# Altium schematic sheet 03_ADV7511_HDMI_OUT.SchDoc
size A3; SheetNumber: 4; SheetTotal: 6
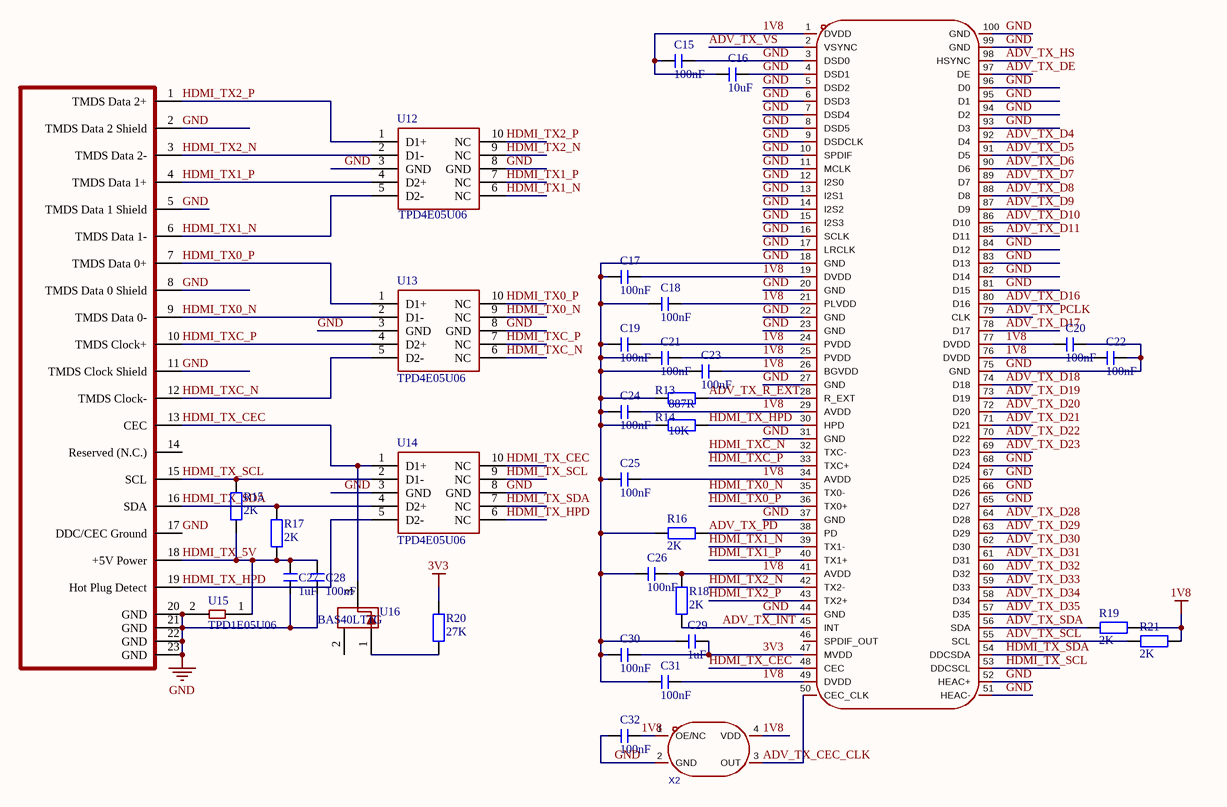
[diagram p0: 03_ADV7511_HDMI_OUT.SchDoc]

## Parts
C15  100nF  [C 0603_L]
C16  10uF  [C 0603_L]
C17  100nF  [C 0603_L]
C18  100nF  [C 0603_L]
C19  100nF  [C 0603_L]
C20  100nF  [C 0603_L]
C21  100nF  [C 0603_L]
C22  100nF  [C 0603_L]
C23  100nF  [C 0603_L]
C24  100nF  [C 0603_L]
C25  100nF  [C 0603_L]
C26  100nF  [C 0603_L]
C27  1uF  [C 0603_L]
C28  100nF  [C 0603_L]
C29  1uF  [C 0603_L]
C30  100nF  [C 0603_L]
C31  100nF  [C 0603_L]
C32  100nF  [C 0603_L]
R13  887R  [R 0603_L]
R14  10K  [R 0603_L]
R15  2K  [R 0603_L]
R16  2K  [R 0603_L]
R17  2K  [R 0603_L]
R18  2K  [R 0603_L]
R19  2K  [R 0603_L]
R20  27K  [R 0603_L]
R21  2K  [R 0603_L]
U5  adv7511kstz  [LQFP-100_L14.0-W14.0-P0.50-LS16.0-BL]  (value not drawn)
U12  TPD4E05U06  [TPD4E05U06DQAR]
U13  TPD4E05U06  [TPD4E05U06DQAR]
U14  TPD4E05U06  [TPD4E05U06DQAR]
U15  TPD1E05U06  [TPD1E05U06]
U16  BAS40LT1G  [BAS40LT1G]
USB3  hdmi-001s  [HDMI-SMD_HDMI-001S]  (value not drawn)
X2  ot322512mjba4sl  [OSC-SMD_4P-L3.2-W2.5-BL]  (value not drawn)

## Nets
1V8: C15.2 C16.2 C17.1 C18.1 C19.1 C20.2 C21.1 C22.2 C23.1 C24.1 C25.1 C26.1 C31.1 C32.1 R18.1 R19.2 R21.2 U5.1(DVDD) U5.19(DVDD) U5.21(PLVDD) U5.24(PVDD) U5.25(PVDD) U5.26(BGVDD) U5.29(AVDD) U5.34(AVDD) U5.41(AVDD) U5.49(DVDD) U5.76(DVDD) U5.77(DVDD) X2.1(OE/NC) X2.4(VDD)
3V3: C29.1 C30.1 R20.2 U5.47(MVDD)
GND: C15.1 C16.1 C17.2 C18.2 C19.2 C20.1 C21.2 C22.1 C23.2 C24.2 C25.2 C26.2 C27.2 C28.2 C29.2 C30.2 C31.2 C32.2 R13.1 R14.1 R16.1 U5.3(DSD0) U5.4(DSD1) U5.5(DSD2) U5.6(DSD3) U5.7(DSD4) U5.8(DSD5) U5.9(DSDCLK) U5.10(SPDIF) U5.11(MCLK) U5.12(I2S0) U5.13(I2S1) U5.14(I2S2) U5.15(I2S3) U5.16(SCLK) U5.17(LRCLK) U5.18(GND) U5.20(GND) U5.22(GND) U5.23(GND) U5.27(GND) U5.31(GND) U5.37(GND) U5.44(GND) U5.51(HEAC-) U5.52(HEAC+) U5.65(D27) U5.66(D26) U5.67(D25) U5.68(D24) U5.75(GND) U5.81(D15) U5.82(D14) U5.83(D13) U5.84(D12) U5.93(D3) U5.94(D2) U5.95(D1) U5.96(D0) U5.99(GND) U5.100(GND) U12.3(GND) U12.8(GND) U13.3(GND) U13.8(GND) U14.3(GND) U14.8(GND) U15.2(GND) USB3.2(TMDS_Data_2_Shield) USB3.5(TMDS_Data_1_Shield) USB3.8(TMDS_Data_0_Shield) USB3.11(TMDS_Clock_Shield) USB3.17(DDC/CEC_Ground) USB3.20(GND) USB3.21(GND) USB3.22(GND) USB3.23(GND) X2.2(GND)
ADV_TX_CEC_CLK: U5.50(CEC_CLK) X2.3(OUT)
ADV_TX_D4: U5.92(D4)
ADV_TX_D5: U5.91(D5)
ADV_TX_D6: U5.90(D6)
ADV_TX_D7: U5.89(D7)
ADV_TX_D8: U5.88(D8)
ADV_TX_D9: U5.87(D9)
ADV_TX_D10: U5.86(D10)
ADV_TX_D11: U5.85(D11)
ADV_TX_D16: U5.80(D16)
ADV_TX_D17: U5.78(D17)
ADV_TX_D18: U5.74(D18)
ADV_TX_D19: U5.73(D19)
ADV_TX_D20: U5.72(D20)
ADV_TX_D21: U5.71(D21)
ADV_TX_D22: U5.70(D22)
ADV_TX_D23: U5.69(D23)
ADV_TX_D28: U5.64(D28)
ADV_TX_D29: U5.63(D29)
ADV_TX_D30: U5.62(D30)
ADV_TX_D31: U5.61(D31)
ADV_TX_D32: U5.60(D32)
ADV_TX_D33: U5.59(D33)
ADV_TX_D34: U5.58(D34)
ADV_TX_D35: U5.57(D35)
ADV_TX_DE: U5.97(DE)
ADV_TX_HS: U5.98(HSYNC)
ADV_TX_INT: R18.2 U5.45(INT)
ADV_TX_PCLK: U5.79(CLK)
ADV_TX_PD: R16.2 U5.38(PD)
ADV_TX_R_EXT: R13.2 U5.28(R_EXT)
ADV_TX_SCL: R21.1 U5.55(SCL)
ADV_TX_SDA: R19.1 U5.56(SDA)
ADV_TX_VS: U5.2(VSYNC)
HDMI_TX0_N: U5.35(TX0-) U13.2(D1-) U13.9(NC) USB3.9(TMDS_Data_0-)
HDMI_TX0_P: U5.36(TX0+) U13.1(D1+) U13.10(NC) USB3.7(TMDS_Data_0+)
HDMI_TX1_N: U5.39(TX1-) U12.5(D2-) U12.6(NC) USB3.6(TMDS_Data_1-)
HDMI_TX1_P: U5.40(TX1+) U12.4(D2+) U12.7(NC) USB3.4(TMDS_Data_1+)
HDMI_TX2_N: U5.42(TX2-) U12.2(D1-) U12.9(NC) USB3.3(TMDS_Data_2-)
HDMI_TX2_P: U5.43(TX2+) U12.1(D1+) U12.10(NC) USB3.1(TMDS_Data_2+)
HDMI_TX_5V: C27.1 C28.1 R15.1 R17.1 U15.1(IO) USB3.18(+5V_Power)
HDMI_TX_CEC: U5.48(CEC) U14.1(D1+) U14.10(NC) U16.3 USB3.13(CEC)
HDMI_TX_HPD: R14.2 U5.30(HPD) U14.5(D2-) U14.6(NC) USB3.19(Hot_Plug_Detect)
HDMI_TX_SCL: R15.2 U5.53(DDCSCL) U14.2(D1-) U14.9(NC) USB3.15(SCL)
HDMI_TX_SDA: R17.2 U5.54(DDCSDA) U14.4(D2+) U14.7(NC) USB3.16(SDA)
HDMI_TXC_N: U5.32(TXC-) U13.5(D2-) U13.6(NC) USB3.12(TMDS_Clock-)
HDMI_TXC_P: U5.33(TXC+) U13.4(D2+) U13.7(NC) USB3.10(TMDS_Clock+)
NetR20_1: R20.1 U16.1

Not connected (* = marked no-connect by the designer): U5 46(SPDIF_OUT); U16 2; USB3 14(Reserved_(N.C.))

## Library data of the parts
C15-C32 = C: 贴片电容; BOM名称: 无极性贴片电容; 淘宝ID: 封装库来自淘宝 ID：黄晶宝石; 联系售后: https://shop463601444.taobao.com
R13 = R: 贴片电阻1%; BOM名称: 贴片电阻; 版权归属: 来自淘宝 ID：黄晶宝石; 联系售后: https://shop463601444.taobao.com
R14-R21 = R: 贴片电阻; 版权归属: 来自淘宝 ID：黄晶宝石; BOM名称: 贴片电阻; 联系售后: https://shop463601444.taobao.com
U5 = adv7511kstz: 接口类型:I2S；I2C;数据速率:-;; Manufacturer: ADI(亚德诺); AddInBom: yes; ModelId: 469e6cc70557486dbd01fd12ff814964; ModelName: LQFP-100_L14.0-W14.0-H1.4-LS16.0-P0.50; ModelTransform: 629.92,629.92,0,0,0,0,0,0,0; Voltage - Supply: 1.8V~3.3V; Symbol: ADV7511KSTZ; LCSC Part Name: 225 MHz, 高性能HDMI发射器带ARC; SupplierPart: C179459; ManufacturerPart: ADV7511KSTZ; Supplier Footprint: LQFP-100(14x14); JLCPCB Part Class: Extended Part; Datasheet: https://item.szlcsc.com/datasheet/ADV7511KSTZ/190853.html; Supplier: LCSC; ConvertToPcb: yes; FootprintName: LQFP-100_L14.0-W14.0-P0.50-LS16.0-BL; Interface: I2S；I2C; Data Rate: -; Operating Temperature: 0℃~+70℃; Supply Current: -; Quiescent Supply Current: -; Features: 中断生成
U12-U14 = TPD4E05U06: TVS 5V ESD
U15 = TPD1E05U06: 单通道ESD
U16 = BAS40LT1G: 肖特基二极管
USB3 = hdmi-001s: 19PIN A型前插后贴HDMI插座 铜壳; Manufacturer: XUNPU(讯普); AddInBom: yes; ModelId: 95350f9f774e4f059b8c605506db97f9; ModelTransform: 590.5878,468.503,0,0,0,0,0,-79.567,-85.039; Connector Type: HDMI-A; Gender: 母; Symbol: HDMI-001S; LCSC Part Name: HDMI-A 母 19P; SupplierPart: C720616; ManufacturerPart: HDMI-001S; Supplier Footprint: SMD; JLCPCB Part Class: Extended Part; Datasheet: https://item.szlcsc.com/datasheet/HDMI-001S/763623.html; Supplier: LCSC; ConvertToPcb: yes; FootprintName: HDMI-SMD_HDMI-001S; ModelName: HDMI-SMD_HDMI-001S; Number of Pins: 19P; Mounting Type: 卧贴; Current Rating: -; Voltage Rating: -; Operating Temperature: -
X2 = ot322512mjba4sl: 频率:12MHz;常温频差:±10ppm;输出模式:CMOS;工作电压:1.8V~3.3V;频率稳定度:±20ppm;; Manufacturer: YXC(扬兴晶振); AddInBom: yes; ModelId: ae22b8d143894765bc8100c37cb6356f; ModelName: OSC-SMD_4P-L3.2-W2.5-H1.0; ModelTransform: 125.984,98.425,0,0,0,0,0,0,0; Value: 12MHz; Normal temperature Frequency Tolerance: ±10ppm; Output Type: CMOS; Frequency Stability: ±20ppm; Symbol: OT322512MJBA4SL; LCSC Part Name: YSO110TR 12MHZ 1.8V-3.3V ±10PPM -40~85℃ (±20PPM) CMOS; SupplierPart: C725989; ManufacturerPart: OT322512MJBA4SL; Supplier Footprint: SMD3225-4P; JLCPCB Part Class: Extended Part; Datasheet: https://item.szlcsc.com/datasheet/OT322512MJBA4SL/772573.html; Supplier: LCSC; ConvertToPcb: yes; FootprintName: OSC-SMD_4P-L3.2-W2.5-BL; Voltage - Supply: 1.8V~3.3V; Operating Temperature: -40℃~+85℃